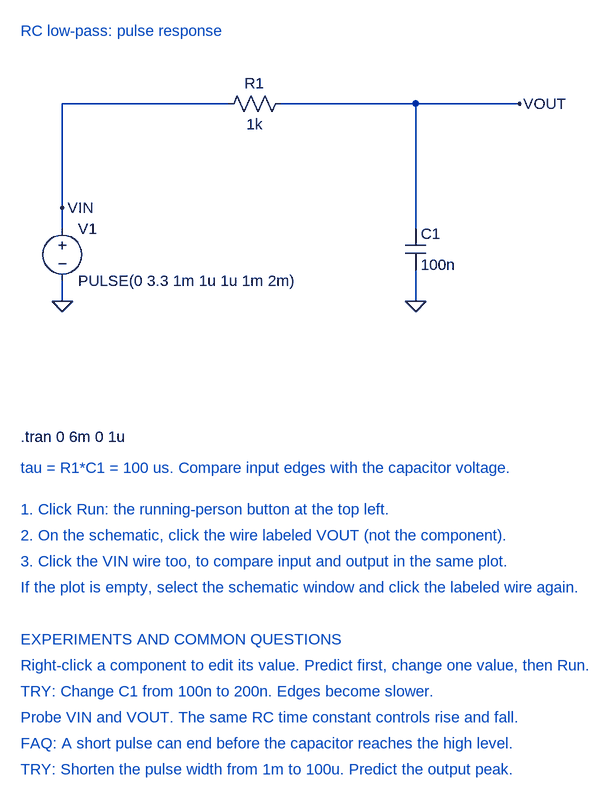
[diagram p0: schematic 10-rc-pulse-response.asc]
10-rc-pulse-response.asc, the LTspice schematic file:
Version 4
SHEET 1 1200 1400
WIRE 128 304 128 336
WIRE 128 416 128 448
WIRE 128 304 128 144
WIRE 128 144 384 144
WIRE 464 144 832 144
WIRE 672 144 672 336
WIRE 672 400 672 448
FLAG 128 304 VIN
FLAG 128 448 0
FLAG 832 144 VOUT
FLAG 672 448 0
SYMBOL voltage 128 320 R0
SYMATTR InstName V1
SYMATTR Value PULSE(0 3.3 1m 1u 1u 1m 2m)
SYMBOL res 480 128 R90
WINDOW 0 0 56 VBottom 2
WINDOW 3 32 56 VTop 2
SYMATTR InstName R1
SYMATTR Value 1k
SYMBOL cap 656 336 R0
SYMATTR InstName C1
SYMATTR Value 100n
TEXT 64 32 Left 2 ;RC low-pass: pulse response
TEXT 64 656 Left 2 !.tran 0 6m 0 1u
TEXT 64 704 Left 2 ;tau = R1*C1 = 100 us. Compare input edges with the capacitor voltage.
TEXT 64 768 Left 2 ;1. Click Run: the running-person button at the top left.
TEXT 64 808 Left 2 ;2. On the schematic, click the wire labeled VOUT (not the component).
TEXT 64 848 Left 2 ;3. Click the VIN wire too, to compare input and output in the same plot.
TEXT 64 888 Left 2 ;If the plot is empty, select the schematic window and click the labeled wire again.
TEXT 64 968 Left 2 ;EXPERIMENTS AND COMMON QUESTIONS
TEXT 64 1008 Left 2 ;Right-click a component to edit its value. Predict first, change one value, then Run.
TEXT 64 1048 Left 2 ;TRY: Change C1 from 100n to 200n. Edges become slower.
TEXT 64 1088 Left 2 ;Probe VIN and VOUT. The same RC time constant controls rise and fall.
TEXT 64 1128 Left 2 ;FAQ: A short pulse can end before the capacitor reaches the high level.
TEXT 64 1168 Left 2 ;TRY: Shorten the pulse width from 1m to 100u. Predict the output peak.

The netlist it stands for:
* 10-rc-pulse-response.asc
V1 VIN 0 PULSE(0 3.3 1m 1u 1u 1m 2m)
R1 VOUT VIN 1k
C1 VOUT 0 100n
* RC low-pass: pulse response
.tran 0 6m 0 1u
* tau = R1*C1 = 100 us. Compare input edges with the capacitor voltage.
* 1. Click Run: the running-person button at the top left.
* 2. On the schematic, click the wire labeled VOUT (not the component).
* 3. Click the VIN wire too, to compare input and output in the same plot.
* If the plot is empty, select the schematic window and click the labeled wire again.
* EXPERIMENTS AND COMMON QUESTIONS
* Right-click a component to edit its value. Predict first, change one value, then Run.
* TRY: Change C1 from 100n to 200n. Edges become slower.
* Probe VIN and VOUT. The same RC time constant controls rise and fall.
* FAQ: A short pulse can end before the capacitor reaches the high level.
* TRY: Shorten the pulse width from 1m to 100u. Predict the output peak.
.backanno
.end